# Altium schematic sheet Top-Sheet.SchDoc
size 420 x 297 mm
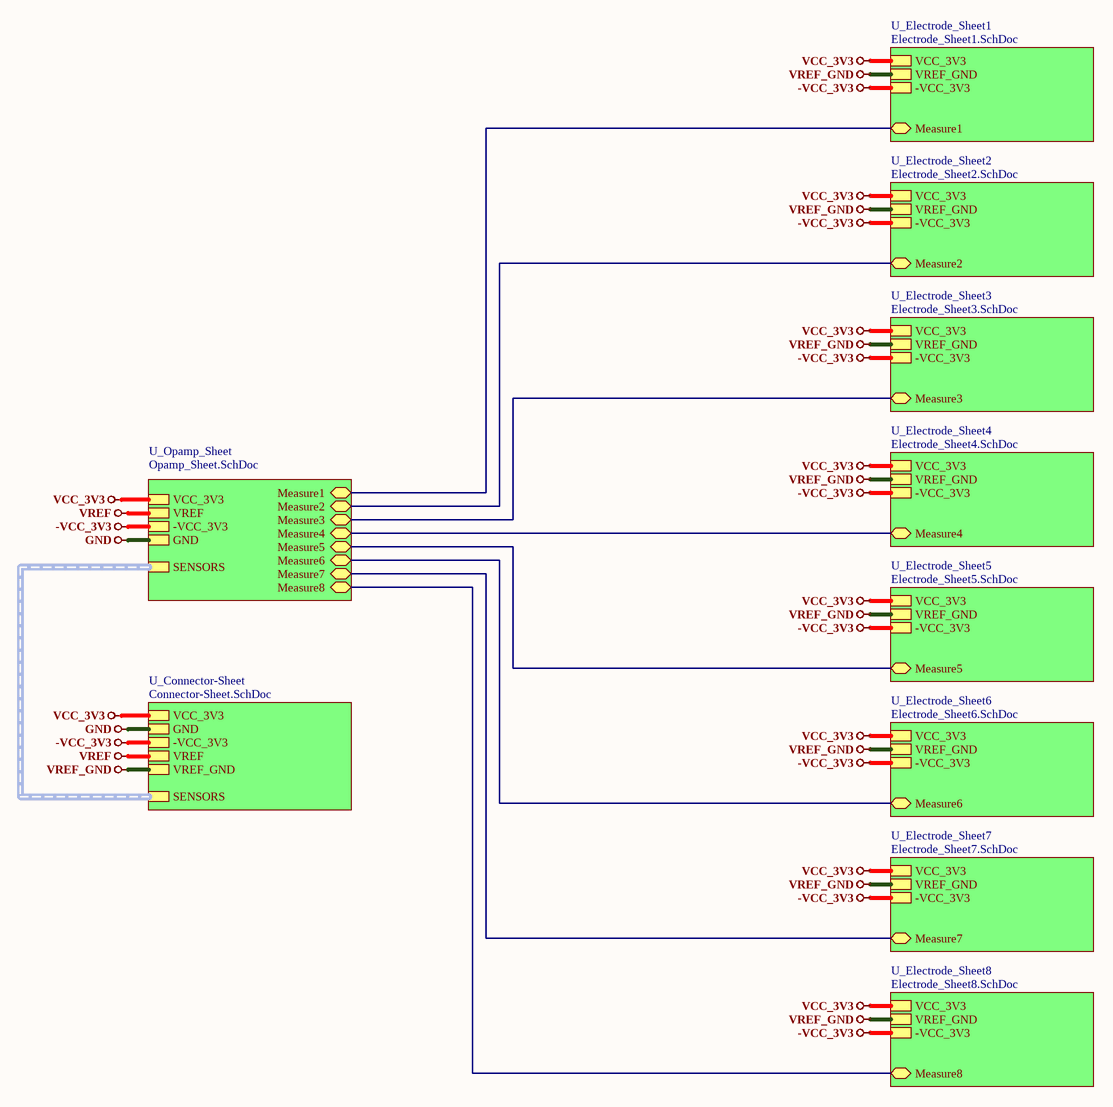
[diagram p0: Top-Sheet.SchDoc]

## Sub-sheets
U_Connector-Sheet = Connector-Sheet.SchDoc: SENSORS (harness SENSORS), -VCC_3V3, VCC_3V3, GND, VREF, VREF_GND
U_Electrode_Sheet1 = Electrode_Sheet1.SchDoc: -VCC_3V3, VREF_GND, VCC_3V3, Measure1 (bidir)
U_Electrode_Sheet2 = Electrode_Sheet2.SchDoc: -VCC_3V3, VREF_GND, VCC_3V3, Measure2 (bidir)
U_Electrode_Sheet3 = Electrode_Sheet3.SchDoc: -VCC_3V3, VREF_GND, VCC_3V3, Measure3 (bidir)
U_Electrode_Sheet4 = Electrode_Sheet4.SchDoc: -VCC_3V3, VREF_GND, VCC_3V3, Measure4 (bidir)
U_Electrode_Sheet5 = Electrode_Sheet5.SchDoc: -VCC_3V3, VREF_GND, VCC_3V3, Measure5 (bidir)
U_Electrode_Sheet6 = Electrode_Sheet6.SchDoc: -VCC_3V3, VREF_GND, VCC_3V3, Measure6 (bidir)
U_Electrode_Sheet7 = Electrode_Sheet7.SchDoc: -VCC_3V3, VREF_GND, VCC_3V3, Measure7 (bidir)
U_Electrode_Sheet8 = Electrode_Sheet8.SchDoc: -VCC_3V3, VREF_GND, VCC_3V3, Measure8 (bidir)
U_Opamp_Sheet = Opamp_Sheet.SchDoc: SENSORS (harness SENSORS), -VCC_3V3, VREF, VCC_3V3, GND, Measure1 (bidir), Measure2 (bidir), Measure3 (bidir), Measure4 (bidir), Measure5 (bidir), Measure6 (bidir), Measure7 (bidir), Measure8 (bidir)

## Nets
-VCC_3V3: sheet U_Opamp_Sheet/-VCC_3V3, sheet U_Connector-Sheet/-VCC_3V3, sheet U_Electrode_Sheet1/-VCC_3V3, sheet U_Electrode_Sheet2/-VCC_3V3, sheet U_Electrode_Sheet3/-VCC_3V3, sheet U_Electrode_Sheet4/-VCC_3V3, sheet U_Electrode_Sheet5/-VCC_3V3, sheet U_Electrode_Sheet6/-VCC_3V3, sheet U_Electrode_Sheet7/-VCC_3V3, sheet U_Electrode_Sheet8/-VCC_3V3
GND: sheet U_Opamp_Sheet/GND, sheet U_Connector-Sheet/GND
VCC_3V3: sheet U_Opamp_Sheet/VCC_3V3, sheet U_Connector-Sheet/VCC_3V3, sheet U_Electrode_Sheet1/VCC_3V3, sheet U_Electrode_Sheet2/VCC_3V3, sheet U_Electrode_Sheet3/VCC_3V3, sheet U_Electrode_Sheet4/VCC_3V3, sheet U_Electrode_Sheet5/VCC_3V3, sheet U_Electrode_Sheet6/VCC_3V3, sheet U_Electrode_Sheet7/VCC_3V3, sheet U_Electrode_Sheet8/VCC_3V3
VREF: sheet U_Opamp_Sheet/VREF, sheet U_Connector-Sheet/VREF
VREF_GND: sheet U_Connector-Sheet/VREF_GND, sheet U_Electrode_Sheet1/VREF_GND, sheet U_Electrode_Sheet2/VREF_GND, sheet U_Electrode_Sheet3/VREF_GND, sheet U_Electrode_Sheet4/VREF_GND, sheet U_Electrode_Sheet5/VREF_GND, sheet U_Electrode_Sheet6/VREF_GND, sheet U_Electrode_Sheet7/VREF_GND, sheet U_Electrode_Sheet8/VREF_GND
(unnamed): sheet U_Opamp_Sheet/Measure1, sheet U_Electrode_Sheet1/Measure1
(unnamed): sheet U_Opamp_Sheet/Measure2, sheet U_Electrode_Sheet2/Measure2
(unnamed): sheet U_Opamp_Sheet/Measure3, sheet U_Electrode_Sheet3/Measure3
(unnamed): sheet U_Opamp_Sheet/Measure4, sheet U_Electrode_Sheet4/Measure4
(unnamed): sheet U_Opamp_Sheet/Measure5, sheet U_Electrode_Sheet5/Measure5
(unnamed): sheet U_Opamp_Sheet/Measure6, sheet U_Electrode_Sheet6/Measure6
(unnamed): sheet U_Opamp_Sheet/Measure7, sheet U_Electrode_Sheet7/Measure7
(unnamed): sheet U_Opamp_Sheet/Measure8, sheet U_Electrode_Sheet8/Measure8

## Buses and harness runs
harness sheet U_Connector-Sheet/SENSORS = sheet U_Opamp_Sheet/SENSORS

## Notes on the sheet
- File:
- Title:
- Date:
- Page
- Num:
- Total:
- Drawn By: Huzaifa Ali